# Altium project GTV3.3_Board.PrjPcb (part 5 of 10)

## Sheet Receiver_Section.SchDoc
size 420 x 297 mm; DocumentNumber: 16; SheetNumber: 16; SheetTotal: 17
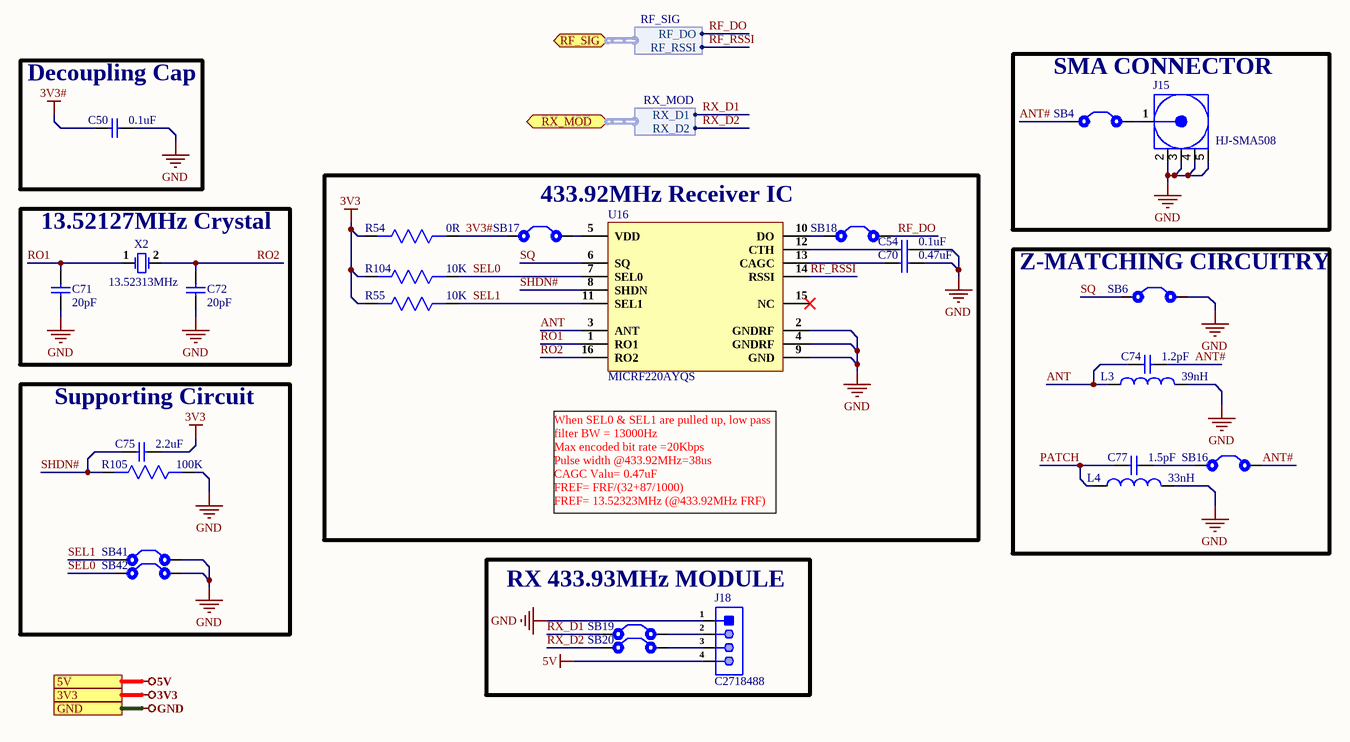
[diagram p9: Receiver_Section.SchDoc]

### Parts
C50  0.1uF  [Cap-0603]
C54  0.1uF  [Cap-0603]
C70  0.47uF  [Cap0603]
C71  20pF  [Cap-0603]
C72  20pF  [Cap-0603]
C74  1.2pF  [Cap0603]
C75  2.2uF  [Cap0603]
C77  1.5pF  [Cap0603]
J15  HJ-SMA508  [HJ-SMA508]
J18  C2718488  [HDR1X4 Female]
L3  39nH  [IND 0402]
L4  33nH  [IND 0603]
R54  0R  [RES-0603]
R55  10K  [Res-0603]
R104  10K  [Res-0603]
R105  100K  [RES-0603]
SB4  Solder Bridge  [Solder Bridge]  (value not drawn)
SB6  Solder Bridge  [Solder Bridge]  (value not drawn)
SB16  Solder Bridge  [Solder Bridge]  (value not drawn)
SB17  Solder Bridge  [Solder Bridge]  (value not drawn)
SB18  Solder Bridge  [Solder Bridge]  (value not drawn)
SB19  Solder Bridge  [Solder Bridge]  (value not drawn)
SB20  Solder Bridge  [Solder Bridge]  (value not drawn)
SB41  Solder Bridge  [Solder Bridge]  (value not drawn)
SB42  Solder Bridge  [Solder Bridge]  (value not drawn)
U16  MICRF220AYQS  [16-QSOP]
X2  13.52313MHz  [HC-49S-2P]

### Blocks framed on the sheet
Decoupling Cap: C50
SMA CONNECTOR: J15 SB4
433.92MHz Receiver IC: C54 C70 R54 R55 R104 SB17 SB18 U16
13.52127MHz Crystal: C71 C72 X2
Z-MATCHING CIRCUITRY: C74 C77 L3 L4 SB6 SB16
Supporting Circuit: C75 R105 SB41 SB42
RX 433.93MHz MODULE: J18 SB19 SB20

### Ports
3V3, 5V, GND, RF_SIG (bidir, harness RF_SIG), RX_MOD (bidir, harness RX_MOD)

### Harnesses
RF_SIG: RF_DO, RF_RSSI
RX_MOD: RX_D1, RX_D2

### Nets
3V3: C75.2 R54.2 R55.2 R104.2 ; port 3V3
3V3#: C50.1 R54.1 SB17.1
5V: J18.4 ; port 5V
GND: C50.2 C54.2 C70.2 C71.1 C72.1 J15.2(GND) J15.3(GND) J15.4(GND) J15.5(GND) J18.1 L3.2 L4.2 R105.1 SB6.2 SB41.2 SB42.2 U16.2(GNDRF) U16.4(GNDRF) U16.9(GND) ; port GND
ANT: C74.1 L3.1 U16.3(ANT)
ANT#: C74.2 SB4.1 SB16.2
PATCH: C77.1 L4.1
RF_DO: SB18.2 ; port RF_SIG.RF_DO
RF_RSSI: U16.14(RSSI) ; port RF_SIG.RF_RSSI
RO1: C71.2 U16.1(RO1) X2.1(OSC1)
RO2: C72.2 U16.16(RO2) X2.2(OSC2)
RX_D1: SB19.1 ; port RX_MOD.RX_D1
RX_D2: SB20.1 ; port RX_MOD.RX_D2
SEL0: R104.1 SB42.1 U16.7(SEL0)
SEL1: R55.1 SB41.1 U16.11(SEL1)
SHDN#: C75.1 R105.2 U16.8(SHDN)
SQ: SB6.1 U16.6(SQ)
NetC54_1: C54.1 U16.12(CTH)
NetC70_1: C70.1 U16.13(CAGC)
NetC77_2: C77.2 SB16.1
NetJ15_1: J15.1(Signal) SB4.2
NetJ18_2: J18.2 SB19.2
NetJ18_3: J18.3 SB20.2
NetSB17_2: SB17.2 U16.5(VDD)
NetSB18_1: SB18.1 U16.10(DO)

Not connected (* = marked no-connect by the designer): U16 15(NC)*

### Notes on the sheet
- When SEL0 & SEL1 are pulled up, low pass filter BW = 13000Hz
  Max encoded bit rate =20Kbps
  Pulse width @433.92MHz=38us
  CAGC Valu= 0.47uF
  FREF= FRF/(32+87/1000)
  FREF= 13.52323MHz (@433.92MHz FRF)
- File:
- Title:
- Date:
- Page
- Num:
- Total:
- Drawn By: Huzaifa Ali

### Library data of the parts
C50 C54 = CC0603ZRY5V9BB104: CAP CER 0.1UF 50V Y5V 0603; Manufacturer: Yageo; Capacitance: 100nF; Tolerance: 80%; Item Type: Capacitor; Supplier 1: Digi-Key; Manufacturer Part Number: CC0603ZRY5V9BB104; Stock 1: 15000880; Pricing 1: 1=0.1, 10=0.075, 100=0.0334, 500=0.02386, 1000=0.01874 (USD); Mount: Surface Mount; Case/Package: 0603; Case Code (Metric): 1608; Case Code (Imperial): 0603; Min Operating Temperature: -30°C; Max Operating Temperature: 85°C; Package Quantity: 1; Voltage Rating: 50V; Packaging: Tape and Reel; Dielectric: Y5V; Termination: SMD/SMT; Voltage Rating (DC): 50V; Length: 1.6mm; Width: 0.031inch; Thickness: 0.035inch; Depth: 0.8mm; Lead Free: Lead Free; ComponentLink1URL: http://www.yageo.com/documents/recent/UPY-GPHC_Y5V_6.3V-to-50V_8.pdf?src-supplier=Digi-Key; ComponentLink1Description: http://www.yageo.com/documents/recent/UPY-GPHC_Y5V_6.3V-to-50V_8.pdf?src-supplier=Digi-Key; ComponentLink2URL: http://www.yageo.com/documents/recent/UPY-GPHC_Y5V_6.3V-to-50V_5.pdf?src-supplier=Avnet+Europe; ComponentLink2Description: http://www.yageo.com/documents/recent/UPY-GPHC_Y5V_6.3V-to-50V_5.pdf?src-supplier=Avnet+Europe; ComponentLink3URL: https://www.verical.com/server-webapp/html/getDatasheet?partID=403611&src-supplier=Verical; ComponentLink3Description: https://www.verical.com/server-webapp/html/getDatasheet?partID=403611&src-supplier=Verical; Supplier Part Number 1: 311-1343-1-ND; Number of Pins: 2; Composition: Ceramic; Voltage: 50V; Height: 0.8mm; Radiation Hardening: No; REACH SVHC: No SVHC; Halogen Free: Halogen Free; ComponentLink4URL: http://www.mouser.com/ds/2/447/Yageo_UPY-GP_NP0_16V-to-50V_9-358835.pdf?src-supplier=Mouser; ComponentLink4Description: http://www.mouser.com/ds/2/447/Yageo_UPY-GP_NP0_16V-to-50V_9-358835.pdf?src-supplier=Mouser; ComponentLink5URL: http://www.farnell.com/datasheets/1132289.pdf?src-supplier=Element14; ComponentLink5Description: http://www.farnell.com/datasheets/1132289.pdf?src-supplier=Element14; LCSC Part Number: C106221
C70 = UMK107B7474KA-TR: CAP CER 0.47uF 50V X7R 0603; Manufacturer: Taiyo Yuden; Tolerance: 10%; Capacitance: 470nF; Supplier 1: Digi-Key; Manufacturer Part Number: UMK107B7474KA-TR; RoHS: Yes; Category: Ceramic Capacitors; Stock 1: 81; Pricing 1: 1=0.21000, 10=0.14800, 50=0.08400, 100=0.06950, 500=0.04876, 1000=0.04036 (USD); Mount: Surface Mount; Case/Package: 0603; Case Code (Metric): 1608; Case Code (Imperial): 0603; Min Operating Temperature: -55°C; Max Operating Temperature: 125°C; Packaging: Tape and Reel; Voltage Rating: 50V; Package Quantity: 1; Dielectric: X7R; Termination: SMD/SMT; Voltage: 50V; Series: M; Voltage Rating (DC): 50V; Construction: Flat; Length: 1.6mm; Width: 0.031inch; Height: 0.8mm; Depth: 0.8mm; Thickness: 0.035inch; Radiation Hardening: No; RoHS Compliant: Yes; Lead Free: Lead Free; Halogen Free: Halogen Free; ComponentLink1URL: https://datasheet.ciiva.com/30063/972umk107b7474ka-tr-30063804.pdf?src-supplier=Onlinecomponents.com; ComponentLink1Description: https://datasheet.ciiva.com/30063/972umk107b7474ka-tr-30063804.pdf?src-supplier=Onlinecomponents.com; ComponentLink2URL: https://datasheet.ciiva.com/11600/umk107b7474ka-tr-ss-11600367.pdf?src-supplier=Avnet; ComponentLink2Description: https://datasheet.ciiva.com/11600/umk107b7474ka-tr-ss-11600367.pdf?src-supplier=Avnet; ComponentLink3URL: https://datasheet.ciiva.com/15922/257umk107b7474ka-tr-15922607.pdf?src-supplier=Onlinecomponents.com; ComponentLink3Description: https://datasheet.ciiva.com/15922/257umk107b7474ka-tr-15922607.pdf?src-supplier=Onlinecomponents.com; ComponentLink4URL: https://datasheet.ciiva.com/6274/mlcc-all-e-6274710.pdf?src-supplier=Digi-Key; ComponentLink4Description: https://datasheet.ciiva.com/6274/mlcc-all-e-6274710.pdf?src-supplier=Digi-Key; ComponentLink5URL: https://datasheet.ciiva.com/5412/mlcc01-e-5412119.pdf?src-supplier=Mouser; ComponentLink5Description: https://datasheet.ciiva.com/5412/mlcc01-e-5412119.pdf?src-supplier=Mouser; ComponentLink6URL: https://datasheet.ciiva.com/6274/mlcc-all-e-6274712.pdf?src-supplier=Digi-Key; ComponentLink6Description: https://datasheet.ciiva.com/6274/mlcc-all-e-6274712.pdf?src-supplier=Digi-Key; ComponentLink7URL: https://datasheet.ciiva.com/6274/mlcc-all-e-6274713.pdf?src-supplier=Digi-Key; ComponentLink7Description: https://datasheet.ciiva.com/6274/mlcc-all-e-6274713.pdf?src-supplier=Digi-Key; Supplier Part Number 1: 587-3170-1-ND
C71 C72 = CC0603JRNPO9BN200: CAP CER 20PF 50V C0G/NPO 0603; Manufacturer: Yageo; Tolerance: 5%; Dielectric: C0G; Supplier 1: Digi-Key; Manufacturer Part Number: CC0603JRNPO9BN200; Stock 1: 259568; Pricing 1: 1=0.1, 10=0.048, 100=0.0214, 500=0.01526, 1000=0.01198 (USD); Mount: Surface Mount; Case/Package: 0603; Number of Pins: 2; Weight: 7.1E-05oz; Case Code (Imperial): 0603; Case Code (Metric): 1608; Min Operating Temperature: -55°C; Max Operating Temperature: 125°C; Capacitance: 20pF; Package Quantity: 4000; Voltage Rating (DC): 50V; Packaging: Tape and Reel; Voltage Rating: 50V; Termination: SMD/SMT; Composition: Ceramic; Length: 1.6mm; Width: 0.8mm; Thickness: 0.035inch; Depth: 0.8mm; REACH SVHC: Unknown; Lead Free: Lead Free; ComponentLink1URL: http://www.farnell.com/datasheets/1132289.pdf?src-supplier=Element14; ComponentLink1Description: http://www.farnell.com/datasheets/1132289.pdf?src-supplier=Element14; ComponentLink2URL: http://www.yageo.com/documents/recent/UPY-GP_NP0_16V-to-50V_16.pdf?src-supplier=Digi-Key; ComponentLink2Description: http://www.yageo.com/documents/recent/UPY-GP_NP0_16V-to-50V_16.pdf?src-supplier=Digi-Key; Supplier Part Number 1: 311-1424-6-ND; LCSC Part Number: C105621
C74 = CC0603CRNPO9BN1R2: CAP CER 1.2PF 50V C0G/NPO 0603; Manufacturer: Yageo; Dielectric: C0G; Insulation Resistance: 10GR; Supplier 1: Arrow Electronics; Manufacturer Part Number: CC0603CRNPO9BN1R2; RoHS: Yes; Category: Ceramic Capacitors; Stock 1: 8000; Pricing 1: 4000=0.00980, 8000=0.00850, 12000=0.00840, 40000=0.00420 (USD); Mount: Surface Mount; Case/Package: 0603; Case Code (Imperial): 0603; Case Code (Metric): 1608; Weight: 7.1E-05oz; Min Operating Temperature: -55°C; Max Operating Temperature: 125°C; Capacitance: 1.2pF; Package Quantity: 4000; Voltage Rating: 50V; Voltage Rating (DC): 50V; Packaging: Tape and Reel; Termination: SMD/SMT; Resistor Type: Ceramic; Series: CC; Length: 1.6mm; Width: 0.031inch; Height: 0.8mm; Thickness: 0.035inch; Depth: 0.8mm; Radiation Hardening: No; REACH SVHC: No SVHC; Lead Free: Lead Free; RoHS Compliant: Yes; ComponentLink1URL: https://datasheet.ciiva.com/26862/getdatasheetpartid-403496-26862685.pdf?src-supplier=Verical; ComponentLink1Description: https://datasheet.ciiva.com/26862/getdatasheetpartid-403496-26862685.pdf?src-supplier=Verical; ComponentLink2URL: https://datasheet.ciiva.com/13209/upy-gp-np0-16v-to-50v-8-13209833.pdf?src-supplier=Mouser; ComponentLink2Description: https://datasheet.ciiva.com/13209/upy-gp-np0-16v-to-50v-8-13209833.pdf?src-supplier=Mouser; ComponentLink3URL: https://datasheet.ciiva.com/8033/1443161-8033679.pdf?src-supplier=Element14; ComponentLink3Description: https://datasheet.ciiva.com/8033/1443161-8033679.pdf?src-supplier=Element14; ComponentLink4URL: https://datasheet.ciiva.com/8033/1443161-8033677.pdf?src-supplier=Element14; ComponentLink4Description: https://datasheet.ciiva.com/8033/1443161-8033677.pdf?src-supplier=Element14; ComponentLink5URL: https://datasheet.ciiva.com/11586/upy-gp-np0-16v-to-50v-8-11586438.pdf?src-supplier=Avnet; ComponentLink5Description: https://datasheet.ciiva.com/11586/upy-gp-np0-16v-to-50v-8-11586438.pdf?src-supplier=Avnet; Supplier Part Number 1: CC0603CRNPO9BN1R2
C75 = UMK107BBJ225MA-T: CAP CER 2.2UF 50V X5R 0603; Manufacturer: Taiyo Yuden; Supplier 1: Digi-Key; Manufacturer Part Number: UMK107BBJ225MA-T; RoHS: Yes; Category: Ceramic Capacitors; Stock 1: 1; Pricing 1: 1=0.26000, 10=0.18100, 50=0.12060, 100=0.10240, 500=0.07232, 1000=0.06327 (USD); RoHS Compliant: Yes; Supplier Part Number 1: 587-6298-1-ND
C77 = CC0603CRNPO9BN1R5: CAP CER 1.5PF 50V C0G/NPO 0603; Manufacturer: Yageo; Dielectric: C0G; Temperature Coefficient: 30ppm/°C; Insulation Resistance: 10GR; Supplier 1: Digi-Key; Manufacturer Part Number: CC0603CRNPO9BN1R5; Stock 1: 34794; Pricing 1: 1=0.1, 10=0.058, 100=0.0259, 500=0.01852, 1000=0.01455 (USD); Mount: Surface Mount; Case/Package: 0603; Weight: 7.1E-05oz; Case Code (Metric): 1608; Case Code (Imperial): 0603; Min Operating Temperature: -55°C; Max Operating Temperature: 125°C; Capacitance: 1.5pF; Voltage Rating: 50V; Voltage Rating (DC): 50V; Package Quantity: 1; Packaging: Tape and Reel; Termination: SMD/SMT; Composition: Ceramic; Voltage: 50V; Length: 1.6mm; Height: 0.8mm; Width: 0.031inch; Thickness: 0.035inch; Depth: 0.8mm; Radiation Hardening: No; REACH SVHC: Unknown; Lead Free: Lead Free; ComponentLink1URL: http://www.yageo.com/documents/recent/UPY-GP_NP0_16V-to-50V_16.pdf?src-supplier=Digi-Key; ComponentLink1Description: http://www.yageo.com/documents/recent/UPY-GP_NP0_16V-to-50V_16.pdf?src-supplier=Digi-Key; ComponentLink2URL: http://www.yageo.com/exep/pages/download/literatures/ProductSelectionGuide%202014_Final_2.pdf?src-supplier=Digi-Key; ComponentLink2Description: http://www.yageo.com/exep/pages/download/literatures/ProductSelectionGuide%202014_Final_2.pdf?src-supplier=Digi-Key; ComponentLink3URL: http://www.mouser.com/ds/2/447/Yageo_UPY-GP_NP0_16V-to-50V_9-358835.pdf?src-supplier=Mouser; ComponentLink3Description: http://www.mouser.com/ds/2/447/Yageo_UPY-GP_NP0_16V-to-50V_9-358835.pdf?src-supplier=Mouser; ComponentLink4URL: http://www.yageo.com/documents/recent/UPY-GP_NP0_16V-to-50V_8.pdf?src-supplier=Avnet; ComponentLink4Description: http://www.yageo.com/documents/recent/UPY-GP_NP0_16V-to-50V_8.pdf?src-supplier=Avnet; ComponentLink5URL: http://www.yageo.com/documents/recent/UPY-GP_NP0_16V-to-50V_8.pdf?src-supplier=Avnet+Europe; ComponentLink5Description: http://www.yageo.com/documents/recent/UPY-GP_NP0_16V-to-50V_8.pdf?src-supplier=Avnet+Europe; ComponentLink6URL: https://www.verical.com/server-webapp/html/getDatasheet?partID=38063&src-supplier=Verical; ComponentLink6Description: https://www.verical.com/server-webapp/html/getDatasheet?partID=38063&src-supplier=Verical; Supplier Part Number 1: 311-1050-6-ND
J15 = HJ-SMA508: 1 Inner bore SMA Board Edge Bend -55℃~+155℃ 50Ω Plugin RF Connectors / Coaxial Connectors ROHS; Manufacturer: HJ Tech; Manufacturer Part Number: HJ-SMA508; Footprint: Custom; ComponentLink1Description: LCSC; ComponentLink1URL: https://lcsc.com/product-detail/RF-Connectors-Coaxial-Connectors_HJ-Tech-HJ-SMA508_C1509209.html
J18 = C2718488: 2.54mm Plugin 3A bronze -40℃~+105℃ Straight 1x4P Top 4 Square Holes Plugin,P=2.54mm Female Headers ROHS; Manufacturer: BOOMELE; Item Type: Header; Manufacturer Part Number: C2718488; Package: Plugin,P=2.54mm; LCSC Part Number: C2718488; ComponentLink1Description: LCSC; ComponentLink1URL: https://www.lcsc.com/product-detail/Female-Headers_BOOMELE-Boom-Precision-Elec-C2718488_C2718488.html
L3 = LQW15AN39NG80D: FIXED IND 39NH 530MA 456MOHM SMD; Manufacturer: Murata; Core Material: Non-Magnetic; Shielding: Unshielded; Tolerance: 2%; DC Resistance (DCR): 456mR; Self Resonant Frequency: 3.4GHz; Test Frequency: 100MHz; Q Factor: 28; Supplier 1: Arrow Electronics; Manufacturer Part Number: LQW15AN39NG80D; RoHS: Yes; Category: Fixed Inductors; Stock 1: 7835; Pricing 1: 1=0.25260, 10=0.20140, 25=0.19280, 100=0.14770, 250=0.13910, 500=0.12490, 1000=0.10220, 3000=0.08400, 6000=0.08290 (USD); Mount: Surface Mount; Case/Package: 0402; Case Code (Metric): 1005; Case Code (Imperial): 0402; Min Operating Temperature: -55°C; Max Operating Temperature: 125°C; Current Rating: 530mA; Packaging: Tape and Reel; Package Quantity: 1; Resistor Type: Wirewound; Inductance: 39nH; Max DC Current: 530mA; Termination: SMD/SMT; Length: 0.039inch; Width: 0.024inch; Height: 0.5mm; Height - Seated (Max): 0.024inch; RoHS Compliant: Yes; ComponentLink1URL: https://datasheet.ciiva.com/24054/product-260692-24054907.pdf?src-supplier=Mouser; ComponentLink1Description: https://datasheet.ciiva.com/24054/product-260692-24054907.pdf?src-supplier=Mouser; ComponentLink2URL: https://datasheet.ciiva.com/29696/l0075e-29696874.pdf?src-supplier=Digi-Key; ComponentLink2Description: https://datasheet.ciiva.com/29696/l0075e-29696874.pdf?src-supplier=Digi-Key; ComponentLink3URL: https://datasheet.ciiva.com/29696/l0075e-29696875.pdf?src-supplier=Digi-Key; ComponentLink3Description: https://datasheet.ciiva.com/29696/l0075e-29696875.pdf?src-supplier=Digi-Key; ComponentLink4URL: https://datasheet.ciiva.com/29696/l0075e-29696876.pdf?src-supplier=Digi-Key; ComponentLink4Description: https://datasheet.ciiva.com/29696/l0075e-29696876.pdf?src-supplier=Digi-Key; Supplier Part Number 1: LQW15AN39NG80D
L4 = HSC0603-33NJ-T: 600mA 33nH ±5% 220mΩ SMD,1.8x1.2x1.02mm Inductors (SMD) ROHS; Manufacturer: EMTEK; Manufacturer Part Number: HSC0603-33NJ-T; Value: 33nH; ComponentLink1Description: LCSC; ComponentLink1URL: https://www.lcsc.com/product-detail/Inductors-span-style-background-color-ff0-SMD-span_EMTEK-HSC0603-33NJ-T_C251779.html
R54 = RC0603FR-070RL: RES SMD 0R, 1%, 0.1W, 0603; Manufacturer: Yageo; Resistance: 0mR; Power Rating: 100mW; Voltage Rating (DC): 50V; Temperature Coefficient: 200ppm/°C; Current Rating: 1A; Working Voltage: 75V; Supplier 1: Arrow Electronics; Manufacturer Part Number: RC0603FR-070RL; RoHS: Yes; Category: Chip SMD Resistors; Stock 1: 1270000; Pricing 1: 5000=0.00320, 5000=0.00490, 50000=0.00450, 500000=0.00250, 2500000=0.00150 (USD); Case/Package: 0603; Number of Pins: 2; Contact Plating: Tin,Matte; Case Code (Metric): 1608; Case Code (Imperial): 0603; Min Operating Temperature: -55°C; Max Operating Temperature: 155°C; Resistor Type: Thick Film; Packaging: Tape and Reel; Tolerance: 1%; Package Quantity: 5000; Voltage Rating: 50V; Number of Terminations: 2; Termination: SMD/SMT; Max Power Dissipation: 100mW; Features: Moisture Resistant; Length: 1.6mm; Width: 0.031inch; Height: 0.45mm; Depth: 0.8mm; Radiation Hardening: No; REACH SVHC: No SVHC; Lead Free: Lead Free; Military Standard: Not; ComponentLink1URL: https://datasheet.ciiva.com/11808/0900766b80f96399-11808172.pdf?src-supplier=RSComponents; ComponentLink1Description: https://datasheet.ciiva.com/11808/0900766b80f96399-11808172.pdf?src-supplier=RSComponents; ComponentLink2URL: https://datasheet.ciiva.com/5558/rc0603-272842-5558341.pdf?src-supplier=Mouser; ComponentLink2Description: https://datasheet.ciiva.com/5558/rc0603-272842-5558341.pdf?src-supplier=Mouser; ComponentLink3URL: https://datasheet.ciiva.com/46382/443971-46382072.pdf?src-supplier=Element14; ComponentLink3Description: https://datasheet.ciiva.com/46382/443971-46382072.pdf?src-supplier=Element14; ComponentLink4URL: https://datasheet.ciiva.com/29721/pyu-r-int-thick-7-29721178.pdf?src-supplier=Digi-Key; ComponentLink4Description: https://datasheet.ciiva.com/29721/pyu-r-int-thick-7-29721178.pdf?src-supplier=Digi-Key; ComponentLink5URL: https://datasheet.ciiva.com/5684/443971-5684699.pdf?src-supplier=Farnell; ComponentLink5Description: https://datasheet.ciiva.com/5684/443971-5684699.pdf?src-supplier=Farnell; ComponentLink6URL: https://datasheet.ciiva.com/7983/443971-7983627.pdf?src-supplier=Element14; ComponentLink6Description: https://datasheet.ciiva.com/7983/443971-7983627.pdf?src-supplier=Element14; ComponentLink7URL: https://datasheet.ciiva.com/29721/pyu-rc0603-51-rohs-l-4-29721179.pdf?src-supplier=Digi-Key; ComponentLink7Description: https://datasheet.ciiva.com/29721/pyu-rc0603-51-rohs-l-4-29721179.pdf?src-supplier=Digi-Key; ComponentLink8URL: https://datasheet.ciiva.com/22643/1868787-22643388.pdf?src-supplier=Element14; ComponentLink8Description: https://datasheet.ciiva.com/22643/1868787-22643388.pdf?src-supplier=Element14; Supplier Part Number 1: RC0603FR-070RL
R55 R104 = RC0603FR-0710KL: RES SMD 10K Ohm 1% 1/10W 0603; Manufacturer: Yageo; Voltage Rating: 75V; Resistance: 10kR; Power Rating: 100mW; Temperature Coefficient: 100ppm/°C; Voltage Rating (DC): 50V; Supplier 1: Digi-Key; Manufacturer Part Number: RC0603FR-0710KL; RoHS: Yes; Category: Chip SMD Resistors; Stock 1: 25249139; Pricing 1: 1=0.10000, 10=0.02400, 100=0.00970, 1000=0.00436, 2500=0.00378 (USD); Case/Package: 0603; Case Code (Imperial): 0603; Case Code (Metric): 1608; Size Code: 0603; Min Operating Temperature: -55°C; Max Operating Temperature: 155°C; Packaging: Tape and Reel; Tolerance: 1%; Resistor Type: Thick Film; Termination: SMD/SMT; Number of Terminations: 2; Max Power Dissipation: 100mW; Features: Moisture Resistant; Series: RC; Construction: Rectangular; Length: 1.6mm; Width: 0.8mm; Height: 0.45mm; Depth: 0.8mm; Military Standard: Not; Lead Free: Lead Free; RoHS Compliant: Yes; ComponentLink1URL: https://datasheet.ciiva.com/7660/38590-7660789.pdf?src-supplier=Element14; ComponentLink1Description: https://datasheet.ciiva.com/7660/38590-7660789.pdf?src-supplier=Element14; Supplier Part Number 1: 311-10.0KHRCT-ND; Number of Pins: 2; Weight: 7.1E-05oz; Resistance Tolerance: 1%; Lead Pitch: 0.3mm; REACH SVHC: Unknown; ComponentLink2URL: https://datasheet.ciiva.com/7983/443971-7983596.pdf?src-supplier=Element14; ComponentLink2Description: https://datasheet.ciiva.com/7983/443971-7983596.pdf?src-supplier=Element14; ComponentLink3URL: https://datasheet.ciiva.com/22747/443971-22747519.pdf?src-supplier=Element14; ComponentLink3Description: https://datasheet.ciiva.com/22747/443971-22747519.pdf?src-supplier=Element14; ComponentLink4URL: https://datasheet.ciiva.com/46440/1868787-46440891.pdf?src-supplier=Element14; ComponentLink4Description: https://datasheet.ciiva.com/46440/1868787-46440891.pdf?src-supplier=Element14; ComponentLink5URL: https://datasheet.ciiva.com/7746/1738695-7746239.pdf?src-supplier=Element14; ComponentLink5Description: https://datasheet.ciiva.com/7746/1738695-7746239.pdf?src-supplier=Element14; ComponentLink6URL: https://datasheet.ciiva.com/15189/getdatasheetpartid-409289-15189591.pdf?src-supplier=Verical; ComponentLink6Description: https://datasheet.ciiva.com/15189/getdatasheetpartid-409289-15189591.pdf?src-supplier=Verical; LCSC Part Number: C98220
R105 = RC0603FR-07100KL: RES 100K OHM 1% 1/10W 0603; Manufacturer: Yageo; Resistance: 100kR; Temperature Coefficient: 100ppm/°C; Voltage Rating (DC): 50V; Power Rating: 100mW; Working Voltage: 75V; Supplier 1: Digi-Key; Manufacturer Part Number: RC0603FR-07100KL; RoHS: Yes; Category: Chip SMD Resistors; Stock 1: 4230938; Pricing 1: 1=0.10000, 10=0.02400, 100=0.00970, 1000=0.00436, 2500=0.00378 (USD); Case/Package: 0603; Number of Pins: 2; Case Code (Imperial): 0603; Case Code (Metric): 1608; Min Operating Temperature: -55°C; Max Operating Temperature: 155°C; Tolerance: 1%; Resistor Type: Thick Film; Packaging: Tape and Reel; Voltage Rating: 50V; Termination: SMD/SMT; Number of Terminations: 2; Features: Moisture Resistant; Series: RC; Max Power Dissipation: 100mW; Resistance Tolerance: 1%; Construction: Rectangular; Technology: THICK FILM; Length: 1.6mm; Width: 0.8mm; Height: 0.45mm; Depth: 0.8mm; REACH SVHC: No SVHC; Lead Free: Lead Free; Military Standard: Not; RoHS Compliant: Yes; Supplier Part Number 1: 311-100KHRCT-ND
SB4 SB6 SB16-SB20 SB41 SB42 = Solder Bridge: Solder Bridge ON
U16 = MICRF220AYQS: RF RX ASK/OOK 300-450MHZ 16QSOP; Manufacturer: Microchip; Data Rate: 20Kbps; Nominal Supply Current: 4.3mA; Min Supply Voltage: 3V; Max Supply Voltage: 3.6V; Frequency: 450MHz; Sensitivity: -112.5dBm; Current - Receiving: 6mA; Bandwidth: 330kHz; Operating Frequency: 300 MHz to 450 MHz; Min Frequency: 300MHz; Supplier 1: Arrow Electronics; Manufacturer Part Number: MICRF220AYQS; RoHS: Yes; Category: Interface ICs; Stock 1: 5131; Pricing 1: 1=2.15000 (USD); Mount: Surface Mount; Case/Package: QSOP; Number of Pins: 16; Min Operating Temperature: -40°C; Max Operating Temperature: 105°C; Package Quantity: 98; Packaging: Rail/Tube; Series: QwikRadio®; Supply Current: 4.3mA; Max Frequency: 450MHz; Length: 4.9mm; Width: 3.91mm; Height: 1.47mm; Depth: 3.91mm; Radiation Hardening: No; RoHS Compliant: Yes; REACH SVHC: No SVHC; Lead Free: Lead Free; ComponentLink1URL: https://datasheet.ciiva.com/2798/micrf220-2798468.pdf?src-supplier=Digi-Key; ComponentLink1Description: https://datasheet.ciiva.com/2798/micrf220-2798468.pdf?src-supplier=Digi-Key; ComponentLink2URL: https://datasheet.ciiva.com/30475/0900766b81133813-30475820.pdf?src-supplier=RSComponents; ComponentLink2Description: https://datasheet.ciiva.com/30475/0900766b81133813-30475820.pdf?src-supplier=RSComponents; ComponentLink3URL: https://datasheet.ciiva.com/1164/micrf220-1164232.pdf?src-supplier=Element14; ComponentLink3Description: https://datasheet.ciiva.com/1164/micrf220-1164232.pdf?src-supplier=Element14; Supplier Part Number 1: MICRF220AYQS
X2 = S1C13523ZWFAC: 13.52313MHz In-line passive crystal oscillator 20pF 60Ω ±20ppm ±30ppm -40℃~+85℃ HC-49S-2P Crystals ROHS; Manufacturer: JYJE; Manufacturer Part Number: S1C13523ZWFAC; Package: HC-49S-2P; LCSC Part Number: C2681243; ComponentLink1Description: LCSC; ComponentLink1URL: https://www.lcsc.com/product-detail/Crystals_JYJE-S1C13523ZWFAC_C2681243.html